# EasyEDA Pro project climbsnail-spotwelder-45c7d2f7.epro, board Mini控制板切分
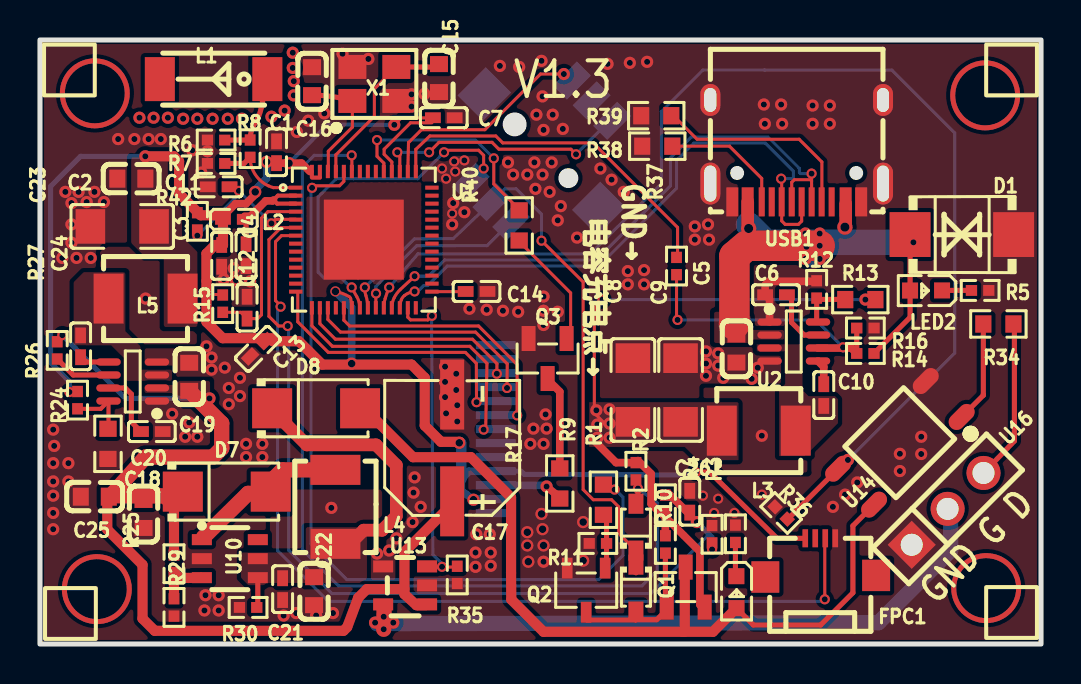
[diagram p8: board, top side]
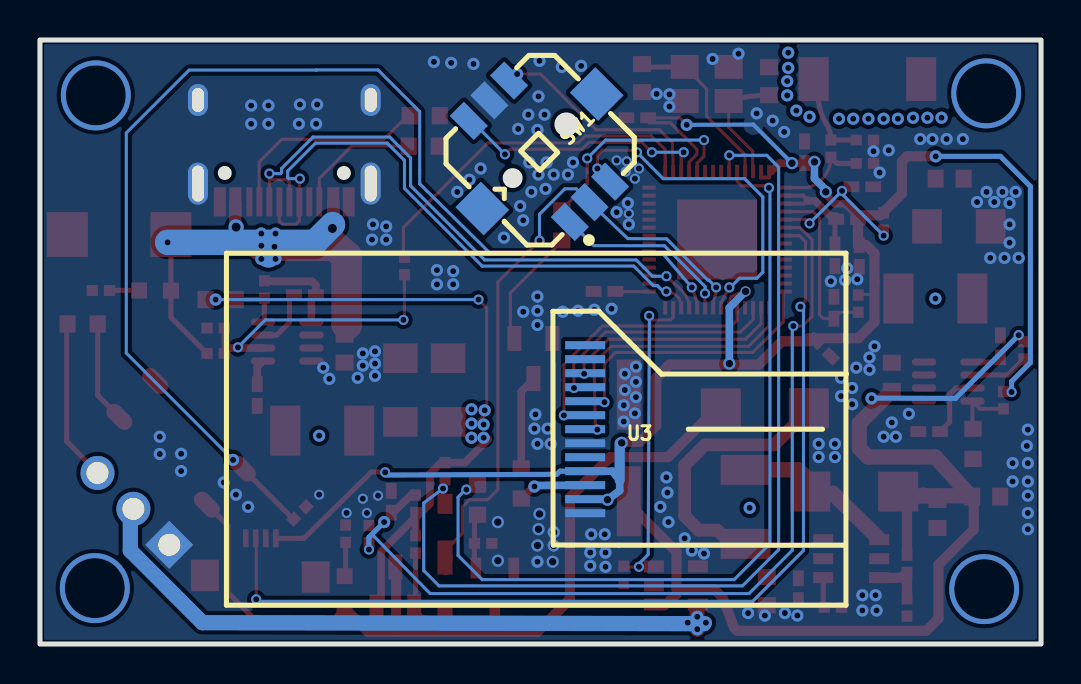
[diagram p9: board, bottom side, seen from below]

Outline 50.09 x 30.2 mm; copper layers: Top Layer, Bottom Layer. Coordinates in mm from the lower left corner of the outline.
Outline path: rectangle 0,30.2 50.09,0
Stack: Top Layer 0.035mm / Dielectric1 1.51mm FR4 er 4.5 / Bottom Layer 0.035mm

## Design rules (mm)
spacing safeClearance (default): track to track 0.152, other pairs 0.152 to 0.3
spacing Plane_innerPlane: track to track 0.152, other pairs 0.152 to 0.3
spacing Copper_copperRegion: track to track 0.152, other pairs 0.152 to 0.3
track width trackWidth (default): min 0.127, default 0.254, max 2.54
differential pair differentialPair (default): width min 0.127, default 0.254, max 2.54; gap min 0.152, default 0.152
pour e508 uses Copper_copperRegion
pour e510 uses Copper_copperRegion
pour e512 uses Copper_copperRegion
pour e515 uses Copper_copperRegion
pour e517 uses Copper_copperRegion
pour e519 uses Copper_copperRegion
pour e521 uses Copper_copperRegion
pour e523 uses Copper_copperRegion
pour e525 uses Copper_copperRegion
pour e527 uses Copper_copperRegion
pour e529 uses Copper_copperRegion

## Placement (name value [footprint] x y rotation side)
C1  -  [C0402]  11.84 24.59 90 top
C2  -  [C0603]  4.57 23.27 0 top
C3  -  [C0402]  9.09 19.41 90 top
C4  -  [C0402]  10.31 19.44 90 top
C5  -  [C0603]  34.85 14.77 90 top
C6  -  [C0402]  36.83 17.46 180 top
C7  -  [C0402]  20.2 26.31 180 top
C8  -  [C1206]  29.67 12.7 270 top
C9  -  [C1206]  32.06 12.7 270 top
C10  -  [C0402]  39.22 12.45 270 top
C11  -  [C0402]  8.94 22.86 0 top
C12  -  [C0402]  10.36 16.81 270 top
C13  -  [C0402]  10.9 14.76 225 top
C14  -  [C0402]  21.84 17.63 180 top
C15  -  [C0603]  19.96 28.3 90 top
C16  -  [C0603]  13.61 28.14 90 top
C17  -  [CAP-SMD_BD6.3-L6.6-W6.6-FD]  20.62 9.8 90 top
C18  -  [C0603]  5.18 6.5 90 top
C19  -  [C0603]  7.47 13.36 270 top
C20  -  [C0402]  5.6 10.62 0 top
C21  -  [C0402]  12.14 2.74 90 top
C22  -  [C0603]  13.72 2.64 90 top
C23  -  [C1206]  4.11 20.88 0 top
C24  -  [C0402]  2.03 14.88 90 top
C25  -  [C0603]  2.74 7.37 0 top
C26  -  [C0402]  32.51 7.11 270 top
D1  -  [SMB_L4.6-W3.6-LS5.3-BI]  46.13 20.47 0 top
D2  -  [SOD-323_L1.8-W1.3-LS2.5-RD]  29.82 5.84 90 top
D3  -  [SOD-323_L1.8-W1.3-LS2.5-RD]  29.82 2.79 270 top
D7  -  [SMA_L4.3-W2.6-LS5.2-RD]  9.35 7.62 0 top
D8  -  [SMA_L4.3-W2.6-LS5.2-RD]  13.82 11.79 0 top
FPC1  -  [FPC-SMD_4P-P0.50_XKB_X05A12H04G]  39.06 4.32 0 top
L1  -  [ANT2051]  8.69 28.24 180 top
L2  -  [L0402]  9.7 21.23 0 top
L3  -  [IND-SMD_L4.2-W4.2-C133189]  35.97 10.67 0 top
L4  -  [IND-SMD_L4.5-W4.0-1]  14.78 6.86 90 top
L5  -  [IND-SMD_L4.2-W4.2-C133189]  5.28 17.27 180 top
LED1  -  [LED0603-RD_BLUE]  34.85 2.59 270 top
LED2  -  [LED0603-RD_BLUE]  44.34 17.68 180 top
Q1  -  [SOT-23-3_L2.9-W1.3-P1.90-LS2.4-BR]  32.31 2.84 270 top
Q2  -  [SOT-23-3_L3.0-W1.7-P0.95-LS2.9-BR]  27.33 2.69 90 top
Q3  -  [SOT-23-3_L2.9-W1.3-P1.90-LS2.4-BR]  25.4 14.27 90 top
R1  -  [R0402]  29.82 8.64 90 top
R2  -  [R0402]  31.29 7.01 270 top
R3  -  [R0402]  34.8 5.51 90 top
R4  -  [R0402]  33.63 5.49 270 top
R5  -  [R0402]  47.04 17.68 180 top
R6  -  [R0402]  8.81 25.2 0 top
R7  -  [R0402]  8.81 24.03 0 top
R8  -  [R0402]  10.52 24.77 270 top
R9  -  [R0603]  28.19 7.21 270 top
R10  -  [R0402]  31.29 4.98 270 top
R11  -  [R0402]  27.92 5.03 0 top
R12  -  [R0402]  38.86 17.73 90 top
R13  -  [R0603]  41.05 17.22 0 top
R14  -  [R0402]  41.3 14.53 0 top
R15  -  [R0402]  9.14 17.02 90 top
R16  -  [R0402]  41.3 15.8 180 top
R17  -  [R0603]  26.01 8.03 90 top
R24  -  [R0603]  3.4 10.01 90 top
R25  -  [R0402]  6.71 4.01 90 top
R26  -  [R0402]  1.88 12.19 270 top
R27  -  [R0402]  0.86 14.68 90 top
R29  -  [R0402]  6.71 1.83 90 top
R30  -  [R0402]  10.41 1.83 0 top
R34  -  [R0603]  47.95 16 180 top
R35  -  [R0402]  20.88 3.45 90 top
R36  -  [R0402]  37.08 6.55 315 top
R37  -  [R0402]  31.85 18.9 270 top
R38  -  [R0603]  30.89 24.89 180 top
R39  -  [R0603]  30.84 26.42 180 top
R40  -  [R0603]  23.98 20.93 90 top
R42  -  [R0402]  7.87 21.13 90 top
SW1  -  [SW-SMD_TM-4175-B-X]  25.09 24.64 45 bottom
U1  -  [QFN-56_L7.0-W7.0-P0.40-TL-EP4.0]  16.2 20.22 0 top
U2  -  [TSOT-23-8_L2.9-W1.6-P0.65-LS2.8-BR]  37.72 15.12 180 top
U3  -  [1.14TFT焊接式B]  25.26 10.74 180 bottom
U10  -  [SOT-23-6_L2.9-W1.6-P0.95-LS2.8-BR]  9.5 4.27 180 top
U11  -  [TSOT-23-8_L2.9-W1.6-P0.65-LS2.8-BR]  4.64 13.12 0 top
U13  -  [SOT-23-5_L2.9-W1.6-P0.95-LS2.8-BR]  18.27 2.93 0 top
U14  -  [SOP-4_L4.4-W3.6-P2.54-LS7.0-TL]  43.03 10.06 225 top
U16  -  [HDR-TH_3P-P2.54-V-M]  45.41 6.76 45 top
USB1  -  [USB-C-SMD_TYPEC-304-BCP16]  37.86 24.65 180 top
X1  -  [OSC-SMD_4P-L3.2-W2.5-BL_SIT8008BI]  16.73 28 0 top

## Footprints (pads in the part's own frame, mm; a bottom-side part is the same pattern mirrored in y, then rotated)
1.14TFT焊接式B
  rect 2x0.4 smd: 1(2.451,4.2) 2(2.451,3.5) 3(2.451,2.8) 4(2.451,2.1) 5(2.451,1.4) 6(2.451,0.7) 7(2.451,0) 8(2.451,-0.7) 9(2.451,-1.4) 10(2.451,-2.1) 11(2.451,-2.8) 12(2.451,-3.5) 13(2.451,-4.2)
ANT2051
  rect 1.5x2.2 smd: 1(-2.69,0) 2(2.69,0)
C0402
  rect 0.79x0.54 smd: 1(-0.545,0) 2(0.545,0)
C0603
  rect 0.8x0.9 smd: 1(-0.7,0) 2(0.7,0)
C1206
  rect 1.485x1.728 smd: 1(-1.593,0) 2(1.593,0)
CAP-SMD_BD6.3-L6.6-W6.6-FD
  rect 3.5x1.2 smd: 1(-2.67,0) 2(2.67,0)
FPC-SMD_4P-P0.50_XKB_X05A12H04G
  rect 0.28x0.9 smd: 1(-0.772,0.968) 2(-0.272,0.968) 3(0.228,0.968) 4(0.728,0.968)
  rect 1.4x1.57 smd: 5(-2.772,-0.968) 6(2.772,-0.889)
HDR-TH_3P-P2.54-V-M
  rect 1.7x1.7 hole 1.1: 1(-2.54,0)
  round 1.7 hole 1.1: 2(0,0) 3(2.54,0)
IND-SMD_L4.2-W4.2-C133189
  rect 1.5x2.5 smd: 1(-1.85,0) 2(1.85,0)
IND-SMD_L4.5-W4.0-1
  rect 1.501x2.499 smd: 1(-1.849,0) 2(1.849,0)
L0402
  rect 0.79x0.54 smd: 1(-0.545,0) 2(0.545,0)
LED0603-RD_BLUE
  rect 0.8x0.8 smd: 1(-0.8,-0.003) 2(0.8,0.003)
OSC-SMD_4P-L3.2-W2.5-BL_SIT8008BI
  rect 1.399x1.199 smd: 1(-1.1,-0.851) 2(1.1,-0.851) 3(1.1,0.851) 4(-1.1,0.851)
QFN-56_L7.0-W7.0-P0.40-TL-EP4.0
  rect 0.665x0.2 smd: 1(-3.408,2.6) 2(-3.408,2.2) 3(-3.408,1.8) 4(-3.408,1.4) 5(-3.408,1) 6(-3.408,0.6) 7(-3.408,0.2) 8(-3.408,-0.2) 9(-3.408,-0.6) 10(-3.408,-1) 11(-3.408,-1.4) 12(-3.408,-1.8) 13(-3.408,-2.2) 14(-3.408,-2.6) 29(3.408,-2.6) 30(3.408,-2.2) 31(3.408,-1.8) 32(3.408,-1.4) 33(3.408,-1) 34(3.408,-0.6) 35(3.408,-0.2) 36(3.408,0.2) 37(3.408,0.6) 38(3.408,1) 39(3.408,1.4) 40(3.408,1.8) 41(3.408,2.2) 42(3.408,2.6)
  rect 0.2x0.665 smd: 15(-2.6,-3.408) 16(-2.2,-3.408) 17(-1.8,-3.408) 18(-1.4,-3.408) 19(-1,-3.408) 20(-0.6,-3.408) 21(-0.2,-3.408) 22(0.2,-3.408) 23(0.6,-3.408) 24(1,-3.408) 25(1.4,-3.408) 26(1.8,-3.408) 27(2.2,-3.408) 28(2.6,-3.408) 43(2.6,3.408) 44(2.2,3.408) 45(1.8,3.408) 46(1.4,3.408) 47(1,3.408) 48(0.6,3.408) 49(0.2,3.408) 50(-0.2,3.408) 51(-0.6,3.408) 52(-1,3.408) 53(-1.4,3.408) 54(-1.8,3.408) 55(-2.2,3.408) 56(-2.6,3.408)
  rect 4x4 smd: 57(0,0)
R0402
  rect 0.566x0.54 smd: 1(-0.433,0) 2(0.433,0)
R0603
  rect 0.806x0.864 smd: 1(-0.753,0) 2(0.753,0)
SMA_L4.3-W2.6-LS5.2-RD
  rect 2x2 smd: 1(-2.2,0) 2(2.2,0)
SMB_L4.6-W3.6-LS5.3-BI
  rect 2.047x2.241 smd: 1(-2.591,0) 2(2.591,0)
SOD-323_L1.8-W1.3-LS2.5-RD
  rect 1x0.75 smd: 1(-1.173,0) 2(1.173,0)
SOP-4_L4.4-W3.6-P2.54-LS7.0-TL
  oval 1.508x0.8 smd: 1(-3.1,1.27) 2(-3.1,-1.27) 3(3.1,-1.27) 4(3.1,1.27)
SOT-23-3_L2.9-W1.3-P1.90-LS2.4-BR
  rect 1.25x0.7 smd: 1(1,-0.95) 2(1,0.95) 3(-1,0)
SOT-23-3_L3.0-W1.7-P0.95-LS2.9-BR
  rect 1.038x0.532 smd: 1(1.101,-0.95) 2(1.101,0.95) 3(-1.101,0)
SOT-23-5_L2.9-W1.6-P0.95-LS2.8-BR
  rect 1.001x0.6 smd: 1(1.1,-0.95) 2(1.1,0) 3(1.1,0.95) 4(-1.1,0.95) 5(-1.1,-0.95)
SOT-23-6_L2.9-W1.6-P0.95-LS2.8-BR
  rect 1x0.55 smd: 1(1.4,-0.95) 2(1.4,0) 3(1.4,0.95) 4(-1.4,0.95) 5(-1.4,0) 6(-1.4,-0.95)
SW-SMD_TM-4175-B-X
  rect 1.7x1 smd: 1(-3.575,1.425) 2(-3.575,0.028) 3(-3.575,-1.425) 4(3.575,1.425) 5(3.575,-0.028) 6(3.575,-1.425)
  rect 2x1.8 smd: 7(0,-4.05) 7(0,4.05)
TSOT-23-8_L2.9-W1.6-P0.65-LS2.8-BR
  oval 1.222x0.363 smd: 1(1.212,-0.976) 2(1.212,-0.325) 3(1.212,0.325) 4(1.212,0.976) 5(-1.212,0.976) 6(-1.212,0.325) 7(-1.212,-0.325) 8(-1.212,-0.976)
USB-C-SMD_TYPEC-304-BCP16
  oval 1.001x2.1 hole 0.6x1.801: 13(-4.321,1.633) 14(4.321,1.633)
  oval 1.001x1.6 hole 0.6x1.199: 15(-4.321,-2.547) 16(4.321,-2.547)
  rect 0.6x1.45 smd: A1B12(-3.226,2.547) A4B9(-2.451,2.547) B1A12(3.22,2.547) B4A9(2.451,2.547)
  rect 0.299x1.45 smd: A5(-1.25,2.547) A6(-0.249,2.547) A7(0.249,2.547) A8(1.25,2.547) B5(1.75,2.547) B6(0.75,2.547) B7(-0.75,2.547) B8(-1.75,2.547)

## Nets
3V3: C1.1 C2.2 C3.2 C7.2 C13.1 C23.2 FPC1.1 L2.1 L5.1 R15.2 R26.1 R42.2 U1.20 U1.46 U1.55 U1.56 U3.10 U3.12
+12V: C17.1 C18.2 C19.2 C25.2 D7.1 R25.2 R27.2 U11.2 U13.1
GND: C1.2 C2.1 C3.1 C4.1 C5.1 C6.2 C7.1 C8.1 C9.1 C11.1 C12.1 C13.2 C14.1 C15.1 C16.2 C17.2 C18.1 C19.1 C20.2 C21.1 C22.1 C23.1 C25.1 C26.1 D1.2 FPC1.4 Q2.2 Q3.2 R3.2 R4.1 R5.1 R6.1 R7.1 R11.1 R12.2 R16.1 R24.1 R29.1 R30.1 R35.1 R36.1 R38.2 R39.2 SW1.5 U1.57 U2.1 U2.4 U3.8 U3.13 U10.2 U11.1 U11.4 U13.2 U13.4 U14.2 U16.1 USB1.13 USB1.14 USB1.15 USB1.16 USB1.A1B12 USB1.B1A12 X1.2 X1.4
VBUS: C5.2 D1.1 LED2.2 R14.2 U2.2 USB1.A4B9 USB1.B4A9
+CAP: C8.2 C9.2 L3.1 Q1.2 R1.2 R2.2 R10.1 R13.2
BOOT: C11.2 R42.1 U1.5
CAP_VOL: C26.2 R2.1 R4.2 U1.6
CUR_VOL: FPC1.3 U1.7
DCDC_PWR_EN: R37.1 U1.43
ENTER: D2.1 D3.1 SW1.2 U1.22
ESP_EN: C12.2 R15.1 U1.4
IO19: U1.25 USB1.A7 USB1.B7
IO20: U1.26 USB1.A6 USB1.B6
KEY_D: SW1.6 U1.44
KEY_L: SW1.3 U1.21
KEY_R: SW1.4 U1.45
KEY_UP: SW1.1 U1.23
MOS_D: R34.1 U16.3
MOS_G: U13.5 U16.2
MOS_SW: R35.2 U1.27 U13.3
POWER_CHECK: D2.2 R1.1 U1.51
SHORT_EN: R36.2 U1.24 U14.3
START_POWER_EN: R9.1 U1.52
TFT_BL: R40.2 U1.47
TFT_CS: U1.15 U3.7
TFT_DC: U1.14 U3.5
TFT_MISO: U1.18
TFT_MOSI: U1.16 U3.3
TFT_RST: U1.19 U3.6
TFT_SCLK: U1.17 U3.4
WORK+: D8.2 LED1.2 Q1.3 U14.4
XTAL_N: C15.2 U1.53 X1.3
XTAL_P: C16.1 U1.54 X1.1
$1N280: D7.2 L4.2 U10.1
$1N506: R25.1 R29.2 U10.3
$1N673: C21.2 C22.2 D8.1 L4.1 R30.2 U10.4 U10.5
$1N80208: C10.2 L3.2 U2.3
$1N83125: C10.1 U2.5
$1N83932: C6.1 U2.7
$1N85156: R12.1 R13.1 U2.8
$1N86985: C24.2 L5.2 U11.3
$1N86986: C24.1 U11.5
$1N86989: R27.1 U11.6
$1N86990: C20.1 U11.7
$1N86995: R24.2 R26.2 U11.8
$1N89886: D3.2 Q1.1 Q2.3 R10.2
$1N90159: Q2.1 R9.2 R11.2
$1N102735: C4.2 L2.2 U1.2 U1.3
$1N104052: C14.2 U1.29
$1N111735: R7.2 R8.2 U1.1
$1N112405: L1.1 R6.2 R8.1
$1N115607: LED1.1 R3.1
$1N115916: LED2.1 R5.2
$1N154799: R34.2 U14.1
$1N164036: R14.1 R16.2 R37.2 U2.6
$1N177745: R38.1 USB1.B5
$1N177900: R39.1 USB1.A5
$1N182596: Q3.3 R17.2
$1N183266: R17.1 U3.11
$1N186675: Q3.1 R40.1

Pads without a net: FPC1 2 5 6; L1 2; SW1 7; U1 8 9 10 11 12 13 28 30 31 32 33 34 35 36 37 38 39 40 41 42 48 49 50; U3 1 2 9; U10 6; USB1 A8 B8

## Via types
v1: diameter 0.61, hole 0.305, Top Layer to Bottom Layer, 199 vias
v2: diameter 3.5, hole 3, Top Layer to Bottom Layer, 4 vias
v3: diameter 0.508, hole 0.305, Top Layer to Bottom Layer, 51 vias
v4: diameter 0.61, hole 0.381, Top Layer to Bottom Layer, 14 vias
v5: diameter 0.762, hole 0.457, Top Layer to Bottom Layer, 2 vias
v6: diameter 0.508, hole 0.381, Top Layer to Bottom Layer, 1 via

## Routing (per net, layer and track width the routed paths; a pad name or vN(x,y) marks a point on that pad's centre or on a via; arc(x,y) is an arc through that point)
3V3: length 1.3
  Top Layer w0.152: v6(14.78,17.63) arc(15.14,17.53) 15.48,17.36 arc(15.52,17.32) 15.54,17.27 arc(15.59,17.04) U1.20
  vias: v1(5.27,24.38) v1(17.73,25.96) v3(1.47,12.6) v3(32.82,8.59) v4(10.77,22.61) v4(11.34,24.11) v4(12.46,24.04) v4(15.6,14.02) v4(20.98,10.06) v4(21.69,7.21)
+12V:
  vias: v1(8.48,12.28) v3(1.12,15.44)
GND:
  vias: v1(0.66,10.72) v1(0.71,9.91) v1(0.66,9.04) v1(0.66,8.13) v1(0.66,7.42) v1(0.66,6.55) v1(0.66,5.74) v1(1.12,19.3) v1(1.27,22.61) v1(1.42,9.04) v1(1.42,8.13) v1(1.57,22.05) v1(1.57,20.98) v1(1.57,20.07) v1(1.83,19.3) v1(1.93,22.61) v1(2.34,22.1) v1(2.54,19.3) v1(2.73,22.61) v1(3.2,22.1) v1(3.91,25.25) v1(4.72,25.25) v1(5.44,25.25) v1(6.04,25.25) v1(6.61,11.51) v1(7.26,10.36) v1(7.47,11.07) v1(7.62,24.69) v1(7.87,10.36) v1(8.08,23.57) v1(8.28,2.44) v1(8.23,1.68) v1(8.38,24.64) v1(8.33,14.88) v1(8.58,14.33) v1(8.58,13.72) v1(8.94,2.44) v1(8.94,1.68) v1(9.19,18.24) v1(9.25,13.82) v1(9.45,12.8) v1(9.45,11.99) v1(9.7,18.78) v1(9.8,18.19) v1(10.01,13.31) v1(10.01,12.39) v1(10.31,10.01) v1(10.31,9.35) v1(10.52,18.14) v1(11.12,10.01) v1(11.12,9.35) v1(12.19,1.42) v1(12.85,25.6) v1(12.82,1.55) v1(13.43,26.17) v1(13.82,1.42) v1(14.23,26.53) v1(14.66,1.55) v1(15.14,29.51) v1(16.43,29.25) v1(16.87,4.52) v1(17.47,4.67) v1(17.83,5.28) v1(18.59,27.48) v1(18.59,26.87) v1(18.69,7.57) v1(18.64,6.1) v1(18.75,8.33) v1(19.05,6.86) v1(19.24,27.5) v1(20.27,13.87) v1(20.27,13.11) v1(20.27,12.34) v1(20.32,11.53) v1(20.68,22.05) v1(20.62,20.98) v1(20.83,13.51) v1(20.83,12.7) v1(20.88,11.94) v1(20.88,11.12) v1(21.23,21.59) v1(21.49,16.76) v1(21.79,4.57) v1(21.79,3.86) v1(21.83,5.49) v1(22.35,16.71) v1(22.5,5.49) v1(22.56,4.57) v1(22.56,3.91) v1(23.01,28.91) v1(23.16,16.66) v1(23.42,24.08) v1(23.67,23.47) v1(23.98,28.85) v1(23.93,16.61) v1(24.38,23.47) v1(24.54,10.01) v1(24.69,10.77) v1(24.74,24.08) v1(24.79,22.76) v1(24.84,26.47) v1(25.09,29.16) v1(25.15,27.38) v1(25.2,25.7) v1(25.15,23.47) v1(25.2,17.37) v1(25.2,16.66) v1(25.2,15.95) v1(25.2,10.01) v1(25.2,4.11) v1(25.3,11.48) v1(25.35,10.77) v1(25.5,22.61) v1(25.6,24.08) v1(25.65,26.47) v1(25.91,21.18) v1(25.91,16.61) v1(26.06,21.89) v1(26.16,25.76) v1(26.87,20.32) v1(28.04,23.77) v1(28.4,29.01) v1(28.6,23.22) v1(29.21,22.61) v1(29.41,18.64) v1(29.41,17.98) v1(29.51,29.06) v1(30.23,18.69) v1(30.23,17.98) v1(30.38,29.11) v1(32.77,20.88) v1(32.77,20.22) v1(33.32,14.63) v1(33.32,14.02) v1(33.32,13.41) v1(33.43,20.98) v1(33.48,20.22) v1(33.93,14.53) v1(33.93,13.92) v1(34.19,13.31) v1(35.61,13.26) v1(35.92,13.82) v1(36.22,26.97) v1(36.27,26.01) v1(37.08,26.97) v1(37.13,26.01) v1(38.66,26.92) v1(38.66,26.01) v1(39.52,26.92) v1(39.52,26.01) v1(39.67,6.86) v1(40.28,7.47) v1(40.89,8.08) v1(43.03,9.51) v1(43.03,8.65) v1(44.09,10.36) v1(44.09,9.5) v3(20.12,23.77) v3(20.32,23.27) v3(20.62,21.52) v3(20.73,24.13) v3(20.78,23.62) v3(21.23,24.18) v3(33.17,7.42) v3(33.73,6.55) v3(33.93,7.26) v3(34.75,6.55) v3(36.12,7.47) v4(24.38,5.59) v4(24.38,4.93) v4(24.44,4.11) v4(25.09,6.5) v4(25.15,5.74) v4(25.2,4.93) v4(27.18,6.1) v4(27.18,4.17)
VBUS: length 6.4
  Top Layer w0.254: R14.2 43.54,16.33 LED2.2 43.54,19.91 v1(43.7,20.08)
  vias: v1(38.3,20.52) v1(38.3,19.25) v1(38.35,19.86) v1(39.01,20.52) v1(39.01,19.91) v1(39.01,19.25) v5(35.46,20.78) v5(40.28,20.84)
(no net):
  vias: v1(4.98,26.31) v1(5.69,26.31) v1(6.4,26.31) v1(7.16,26.26) v1(7.87,26.26) v1(8.64,26.26) v1(9.4,26.26) v1(10.11,26.26) v1(11.58,26.37) v1(12.24,26.67) v1(12.65,29.57) v1(12.65,28.8) v1(12.7,28.14) v1(12.7,27.43) v2(2.74,27.53) v2(2.84,2.74) v2(47.29,27.43) v2(47.35,2.79)
+CAP: length 2.6
  Top Layer w0.381: 27.66,10.24 28.83,9.07 R1.2
  vias: v1(27.84,11.68) v1(27.89,10.97) v1(27.89,10.31) v1(28.5,11.73) v1(28.5,11.02) v1(28.5,10.31) v1(41.3,17.22) v3(28.15,17.22)
BOOT: length 1.3
  Top Layer w0.152: U1.5 12.78,21.23 11.79,21.23 v3(11.58,21.03)
  vias: v3(7.87,20.42) v3(9.96,22.66)
CAP_VOL: length 1.7
  Bottom Layer w0.254: v1(32.87,6.1) 33.63,5.33 v3(33.63,4.72)
  vias: v3(12.39,15.9)
CUR_VOL:
  vias: v3(12.04,16.87) v3(39.27,2.23)
ENTER: length 2.1
  Top Layer w0.152: U1.22 arc(16.38,17.12) 16.31,17.42 arc(16.26,17.63) v3(16.26,17.83)
  Top Layer w0.254: D2.1 29.82,3.56
  vias: v3(25.09,20.17)
IO19: length 26.5
  Top Layer w0.152: U1.25 arc(17.64,17.07) 17.73,17.32 arc(17.86,17.54) 18.03,17.73 arc(18.39,18.06) v3(18.75,18.39)
  Bottom Layer w0.152: v3(18.75,18.39) 19.44,18.39 20.25,19.2 27.84,19.2 31.55,22.91 31.55,24.31 32.59,25.35 36.43,25.35 38,23.78 38,23.57 38.05,23.52 v3(38.61,23.52)
IO20: length 25.6
  Top Layer w0.152: v3(18.75,17.63) arc(18.48,17.56) 18.24,17.42 arc(18.15,17.33) 18.09,17.22 arc(18.03,17.02) U1.26
  Bottom Layer w0.152: v3(18.75,17.63) 18.91,17.63 19.2,17.92 19.4,17.92 20.38,18.9 27.96,18.9 31.85,22.78 31.85,24.18 32.72,25.04 36.3,25.04 37.69,23.65 37.69,23.32 37.64,23.27 v3(37.08,23.27)
KEY_D:
  vias: v1(26.21,28.5)
KEY_L: length 1.1
  Top Layer w0.152: U1.21 arc(15.97,17.1) 15.85,17.37 arc(15.72,17.6) v3(15.6,17.83)
  vias: v3(20.22,24.59) v3(22.2,23.77)
KEY_R:
  vias: v3(17.88,24.59) v3(19.47,24.59) v3(26.82,24.49)
KEY_UP:
  vias: v3(16.81,17.53)
MOS_G:
  vias: v1(16.77,1.07) v1(17.2,1.36) v1(17.2,0.74) v1(17.68,1.07)
MOS_SW:
  vias: v3(19.61,16.41) v3(20.12,3.86)
NONE1:
  vias: v1(5.28,17.27)
NONE2:
  vias: v1(14.58,6.81)
NONE3:
  vias: v1(36.12,10.41)
POWER_CHECK: length 1.3
  Top Layer w0.254: D2.2 29.92,7.12 v3(29.92,7.77) 29.92,8.1 R1.1
  vias: v3(15.6,24.43)
SHORT_EN: length 1.1
  Top Layer w0.152: U1.24 arc(17.22,17.04) 17.27,17.27 arc(17.36,17.55) v3(17.47,17.83)
  vias: v1(40.43,9.2)
START_POWER_EN:
  vias: v3(13.61,22.81) v3(28.75,7.72)
TFT_BL:
  vias: v3(16.87,25.2) v3(22.71,24.28)
TFT_CS:
  vias: v3(22.2,10.72)
TFT_DC:
  vias: v3(21.84,12.09)
TFT_MOSI:
  vias: v3(22.86,13.51)
TFT_RST:
  vias: v3(23.88,11.43)
TFT_SCLK:
  vias: v3(23.37,12.8)
XTAL_N: length 2.3
  Top Layer w0.254: X1.3 arc(18.97,28.85) 20.12,28.84
XTAL_P: length 6.1
  Top Layer w0.152: X1.1 15.63,25.84 14.43,24.64 14.43,23.65 U1.54
  Top Layer w0.254: C16.1 arc(14.63,27.37) X1.1
$1N89886: length 7.1
  Top Layer w0.254: 27.35,1.2 29.81,1.2 29.82,1.22 30.86,1.22 31.35,1.71 31.29,1.77 31.29,4.52
$1N90159: length 1.5
  Top Layer w0.254: R9.2 28.35,6.31 R11.2
$1N102735: length 1.4
  Top Layer w0.254: 10.25,21.39 10.31,21.32 C4.2
$1N111735: length 4.6
  Top Layer w0.152: U1.1 11.67,22.82 arc(11.55,22.86) 11.43,22.91 arc(10.76,23.49) R8.2
  Top Layer w0.254: R8.2 10.21,24.03 9.25,24.03
$1N112405: length 4.5
  Top Layer w0.254: 9.25,25.2 10.51,25.2 10.52,25.2 arc(10.58,25.65) 10.77,26.06 arc(10.96,26.43) 11.07,26.82 arc(11.22,27.54) L1.1
$1N115607: length 1.7
  Top Layer w0.254: 34.85,3.39 34.8,3.44 R3.1
$1N115916: length 1.5
  Top Layer w0.254: LED2.1 46.61,17.68
$1N154799: length 3.5
  Top Layer w0.254: 47.2,12.49 47.2,16
$1N164036: length 1.3
  Top Layer w0.254: R16.2 R14.1
  vias: v3(31.9,16.2) v3(40.18,14.83)
$1N183266:
  vias: v1(25.35,7.87)

## Copper pours and planes (outline as drawn; the poured copper is in the pictures)
3V3 on Top Layer: 6.2,15.85 7.87,15.85 7.87,19.61 7.11,20.37 7.11,21.74 6.4,22.45 6.4,24.33 4.58,24.33 4.56,24.35 4.56,20.05 5.24,19.37 6.2,19.37
+12V on Top Layer: 5.23,12.55 6.62,12.55 7.2,11.97 8.51,11.97 8.51,13.16 6.97,13.16 6.87,13.06 5.23,13.06
GND on Top Layer: -7.72,51.36 55.47,51.36 55.47,-22.66 -7.72,-22.66
GND on Top Layer: 28.91,19.2 30.73,19.2 30.73,17.42 28.91,17.42
GND on Bottom Layer: -3.4,52.83 52.93,52.83 52.93,-23.85 -3.4,-23.85
VBUS on Top Layer: 37.24,15.7 37.24,15.23 35.73,15.23 35.56,15.05 33.73,15.05 33.73,16.61 35.33,16.61 35.56,16.38 35.56,15.85 35.71,15.7
+CAP on Top Layer: 27.48,12.09 34.95,12.09 34.95,9.19 27.48,9.19
NONE1 on Top Layer: 4.57,19.86 5.18,19.25 6.1,19.25 6.1,15.7 7.63,15.7 7.85,15.48 7.85,15.06 7.77,14.99 5.13,14.99 4.42,15.7 4.42,18.69 4.36,18.75 3.01,18.75 3.01,19.6 3.27,19.86
NONE2 on Top Layer: 11.51,6.37 11.51,4.49 11.53,4.47 13.03,4.47 13.21,4.65 13.21,5.84 16.1,5.84 16.31,5.64 16.31,4.88 17.12,4.88 17.12,7.62 17.02,7.72 12.75,7.72 12.65,7.62 12.65,6.45 12.57,6.37
NONE3 on Top Layer: 33.2,12.82 36.89,12.82 36.89,9.22 38.36,9.22 38.39,9.19 38.39,8.6 38.41,8.59 34.34,8.59 34.32,8.57 33.98,8.91 33.98,8.99 35,8.99 35.1,9.09 35.1,12.14 35.05,12.19 33.2,12.19
$1N673 on Top Layer: 10.05,4.57 13.17,4.57 13.3,4.7 13.3,5.84 16.36,5.84 16.36,3.05 11.33,3.05 11.23,2.95 10.42,2.95 10.05,3.31
$1N80208 on Top Layer: 35.86,14.99 39.93,14.99 39.93,9.4 35.86,9.4
$1N86985 on Top Layer: 6.6,13.72 6.6,13.16 4.27,13.16 4.27,14.22 3.56,14.94 1.73,14.94 1.68,14.88 1.68,18.09 2.18,18.59 4.27,18.59 4.27,15.65 5.03,14.88 5.03,13.72

## Text on the board
Document Layer: V1.3 新增了GPIO0的R42上拉电阻，避免第一次无法开机。
Top Silkscreen Layer: GND G D | V1.3 | 电容充电点→ | GND→
